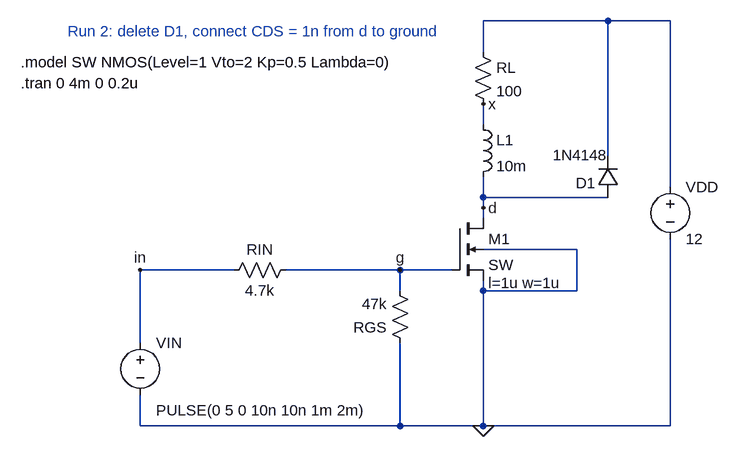
[diagram p0: schematic Ex09.asc]
Ex09.asc, the LTspice schematic file:
Version 4.1
SHEET 1 1200 800
WIRE 432 -304 240 -304
WIRE 528 -304 432 -304
WIRE 240 -256 240 -304
WIRE 240 -144 240 -176
WIRE 432 -96 432 -304
WIRE 528 -48 528 -304
WIRE 240 -32 240 -64
WIRE 432 -32 240 -32
WIRE 240 -16 240 -32
WIRE 240 0 240 -16
WIRE 384 48 240 48
WIRE -144 80 -288 80
WIRE 112 80 -64 80
WIRE 192 80 112 80
WIRE 112 112 112 80
WIRE 240 112 240 96
WIRE 384 112 384 48
WIRE 384 112 240 112
WIRE -288 192 -288 80
WIRE -288 320 -288 272
WIRE 112 320 112 192
WIRE 112 320 -288 320
WIRE 240 320 240 112
WIRE 240 320 112 320
WIRE 528 320 528 32
WIRE 528 320 240 320
FLAG 240 320 0
FLAG -288 80 in
FLAG 112 80 g
FLAG 240 -16 d
FLAG 240 -176 x
SYMBOL nmos4 192 0 R0
WINDOW 39 56 100 Left 2
SYMATTR SpiceLine l=1u w=1u
SYMATTR InstName M1
SYMATTR Value SW
SYMBOL res 128 208 R180
SYMATTR InstName RGS
SYMATTR Value 47k
SYMBOL res -48 64 R90
WINDOW 0 0 56 VBottom 2
WINDOW 3 32 56 VTop 2
SYMATTR InstName RIN
SYMATTR Value 4.7k
SYMBOL res 224 -272 R0
SYMATTR InstName RL
SYMATTR Value 100
SYMBOL ind 224 -160 R0
SYMATTR InstName L1
SYMATTR Value 10m
SYMBOL diode 448 -32 R180
WINDOW 0 35 22 Left 2
WINDOW 3 16 65 Left 2
SYMATTR InstName D1
SYMATTR Value 1N4148
SYMBOL voltage 528 -64 R0
SYMATTR InstName VDD
SYMATTR Value 12
SYMBOL voltage -288 176 R0
WINDOW 123 0 0 Left 0
WINDOW 39 0 0 Left 0
WINDOW 3 24 120 Left 2
SYMATTR Value PULSE(0 5 0 10n 10n 1m 2m)
SYMATTR InstName VIN
TEXT -472 -240 Left 2 !.model SW NMOS(Level=1 Vto=2 Kp=0.5 Lambda=0)
TEXT -472 -208 Left 2 !.tran 0 4m 0 0.2u
TEXT -400 -288 Left 2 ;Run 2: delete D1, connect CDS = 1n from d to ground

The netlist it stands for:
* Ex09.asc
M1 d g 0 0 SW l=1u w=1u
RGS 0 g 47k
RIN g in 4.7k
RL N001 x 100
L1 x d 10m
D1 d N001 1N4148
VDD N001 0 12
VIN in 0 PULSE(0 5 0 10n 10n 1m 2m)
.model D D
.lib standard.dio
.model NMOS NMOS
.model PMOS PMOS
.lib standard.mos
.model SW NMOS(Level=1 Vto=2 Kp=0.5 Lambda=0)
.tran 0 4m 0 0.2u
* Run 2: delete D1, connect CDS = 1n from d to ground
.backanno
.end